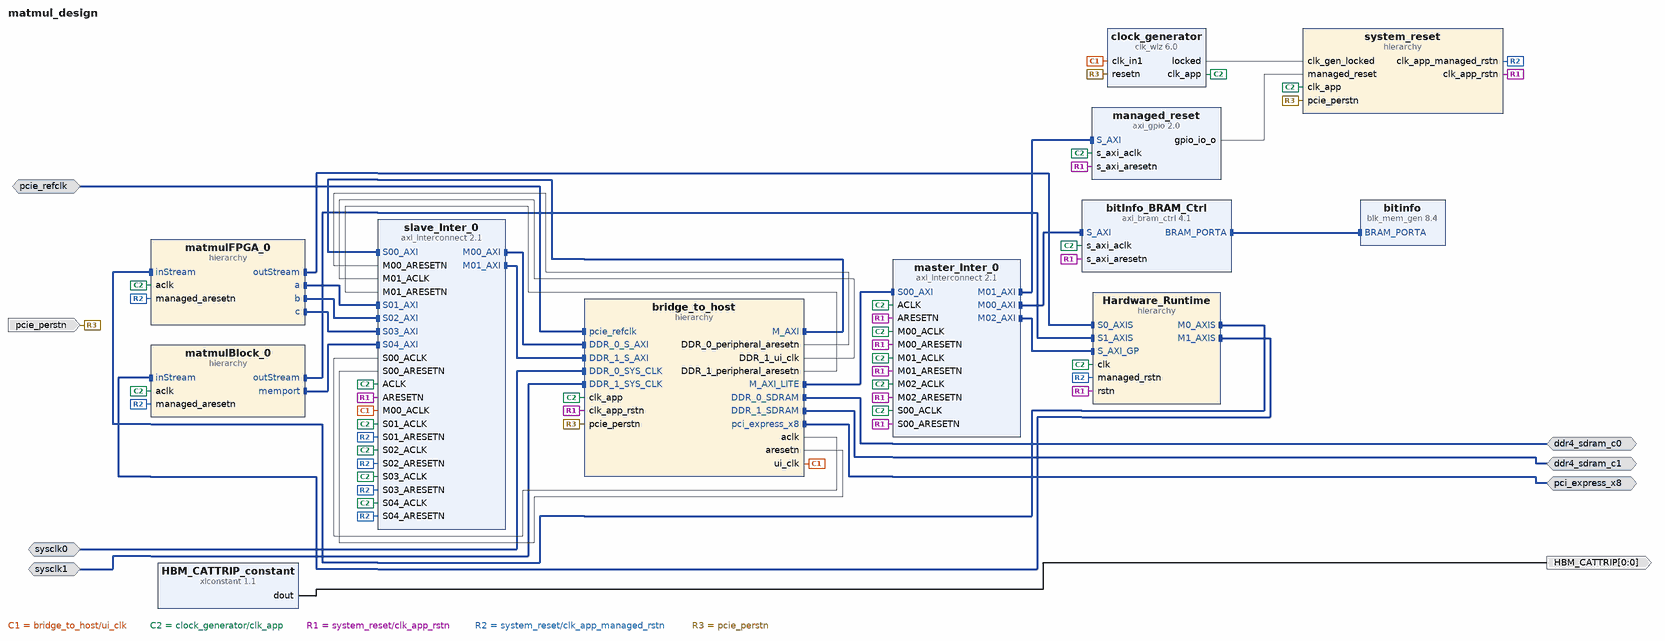
[diagram p0: block diagram of the top level]
# Vivado block design matmul_design, xcu280-fsvh2892-2L-e, Vivado 2023.2
create_bd_design matmul_design

create_bd_intf_port -mode Master -vlnv xilinx.com:interface:ddr4_rtl:1.0 ddr4_sdram_c0
create_bd_intf_port -mode Master -vlnv xilinx.com:interface:ddr4_rtl:1.0 ddr4_sdram_c1
create_bd_intf_port -mode Slave -vlnv xilinx.com:interface:diff_clock_rtl:1.0 sysclk0
create_bd_intf_port -mode Slave -vlnv xilinx.com:interface:diff_clock_rtl:1.0 sysclk1
create_bd_intf_port -mode Master -vlnv xilinx.com:interface:pcie_7x_mgt_rtl:1.0 pci_express_x8
create_bd_intf_port -mode Slave -vlnv xilinx.com:interface:diff_clock_rtl:1.0 pcie_refclk
set_property -dict {CONFIG.FREQ_HZ 100000000} [get_bd_intf_ports pcie_refclk]
create_bd_port -dir O -from 0 -to 0 HBM_CATTRIP
create_bd_port -dir I -type rst pcie_perstn
set_property -dict {CONFIG.POLARITY ACTIVE_LOW} [get_bd_ports pcie_perstn]

create_bd_cell -type hier bridge_to_host
create_bd_cell -type hier system_reset
create_bd_cell -type ip -vlnv xilinx.com:ip:clk_wiz:6.0 clock_generator
set_property -dict [list \
  CONFIG.CLKIN1_JITTER_PS 33.330000000000005 \
  CONFIG.CLKOUT1_JITTER 88.577 \
  CONFIG.CLKOUT1_PHASE_ERROR 77.836 \
  CONFIG.CLKOUT1_REQUESTED_OUT_FREQ 200 \
  CONFIG.CLK_OUT1_PORT clk_app \
  CONFIG.MMCM_CLKFBOUT_MULT_F 4.000 \
  CONFIG.MMCM_CLKIN1_PERIOD 3.333 \
  CONFIG.MMCM_CLKIN2_PERIOD 10.0 \
  CONFIG.MMCM_CLKOUT0_DIVIDE_F 6.000 \
  CONFIG.RESET_BOARD_INTERFACE resetn \
  CONFIG.RESET_PORT resetn \
  CONFIG.RESET_TYPE ACTIVE_LOW \
] [get_bd_cells clock_generator]
create_bd_cell -type ip -vlnv xilinx.com:ip:xlconstant:1.1 HBM_CATTRIP_constant
set_property -dict {CONFIG.CONST_VAL 0} [get_bd_cells HBM_CATTRIP_constant]
create_bd_cell -type ip -vlnv xilinx.com:ip:axi_interconnect:2.1 slave_Inter_0
set_property -dict {CONFIG.NUM_MI 2 CONFIG.NUM_SI 5 CONFIG.STRATEGY 2} [get_bd_cells slave_Inter_0]
create_bd_cell -type ip -vlnv xilinx.com:ip:blk_mem_gen:8.4 bitinfo
set_property -dict [list \
  CONFIG.Coe_File ../../../../../../../bitinfo.coe \
  CONFIG.Enable_32bit_Address true \
  CONFIG.Fill_Remaining_Memory_Locations false \
  CONFIG.Load_Init_File true \
  CONFIG.Memory_Type Single_Port_RAM \
  CONFIG.Read_Width_A 32 \
  CONFIG.Register_PortA_Output_of_Memory_Primitives false \
  CONFIG.Use_RSTA_Pin false \
  CONFIG.Write_Depth_A 82 \
  CONFIG.use_bram_block Stand_Alone \
] [get_bd_cells bitinfo]
create_bd_cell -type ip -vlnv xilinx.com:ip:axi_bram_ctrl:4.1 bitInfo_BRAM_Ctrl
set_property -dict {CONFIG.PROTOCOL AXI4LITE CONFIG.SINGLE_PORT_BRAM 1} [get_bd_cells bitInfo_BRAM_Ctrl]
create_bd_cell -type ip -vlnv xilinx.com:ip:axi_gpio:2.0 managed_reset
set_property -dict {CONFIG.C_ALL_OUTPUTS 1 CONFIG.C_DOUT_DEFAULT 0x00000001 CONFIG.C_GPIO_WIDTH 1} [get_bd_cells managed_reset]
create_bd_cell -type ip -vlnv xilinx.com:ip:axi_interconnect:2.1 master_Inter_0
set_property -dict {CONFIG.NUM_MI 3 CONFIG.NUM_SI 1 CONFIG.STRATEGY 2} [get_bd_cells master_Inter_0]
create_bd_cell -type hier Hardware_Runtime
create_bd_cell -type hier matmulFPGA_0
create_bd_cell -type hier matmulBlock_0

# ---- hierarchy /bridge_to_host ----
current_bd_instance /bridge_to_host
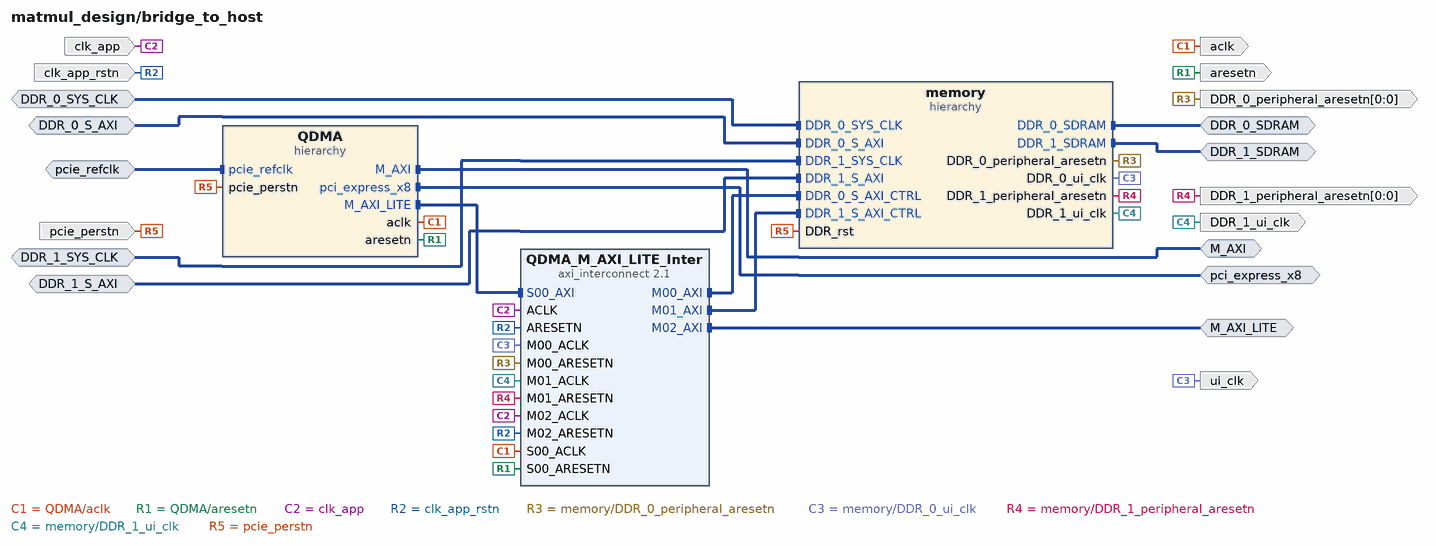
[diagram p1: block diagram inside /bridge_to_host]
create_bd_intf_pin -mode Master -vlnv xilinx.com:interface:aximm_rtl:1.0 M_AXI
create_bd_intf_pin -mode Master -vlnv xilinx.com:interface:aximm_rtl:1.0 M_AXI_LITE
create_bd_intf_pin -mode Master -vlnv xilinx.com:interface:ddr4_rtl:1.0 DDR_0_SDRAM
create_bd_intf_pin -mode Master -vlnv xilinx.com:interface:ddr4_rtl:1.0 DDR_1_SDRAM
create_bd_intf_pin -mode Master -vlnv xilinx.com:interface:pcie_7x_mgt_rtl:1.0 pci_express_x8
create_bd_intf_pin -mode Slave -vlnv xilinx.com:interface:aximm_rtl:1.0 DDR_0_S_AXI
create_bd_intf_pin -mode Slave -vlnv xilinx.com:interface:aximm_rtl:1.0 DDR_1_S_AXI
create_bd_intf_pin -mode Slave -vlnv xilinx.com:interface:diff_clock_rtl:1.0 DDR_0_SYS_CLK
create_bd_intf_pin -mode Slave -vlnv xilinx.com:interface:diff_clock_rtl:1.0 DDR_1_SYS_CLK
create_bd_intf_pin -mode Slave -vlnv xilinx.com:interface:diff_clock_rtl:1.0 pcie_refclk
create_bd_pin -dir O -type clk ui_clk
create_bd_pin -dir I -type clk clk_app
create_bd_pin -dir I -type rst clk_app_rstn
create_bd_pin -dir I -type rst pcie_perstn
create_bd_pin -dir O -from 0 -to 0 -type rst DDR_0_peripheral_aresetn
create_bd_pin -dir O -type clk DDR_1_ui_clk
create_bd_pin -dir O -from 0 -to 0 -type rst DDR_1_peripheral_aresetn
create_bd_pin -dir O -type clk aclk
create_bd_pin -dir O -type rst aresetn

create_bd_cell -type hier memory
create_bd_cell -type hier QDMA
create_bd_cell -type ip -vlnv xilinx.com:ip:axi_interconnect:2.1 QDMA_M_AXI_LITE_Inter
set_property -dict {CONFIG.NUM_MI 3} [get_bd_cells QDMA_M_AXI_LITE_Inter]

# ---- hierarchy /bridge_to_host/memory ----
current_bd_instance /bridge_to_host/memory
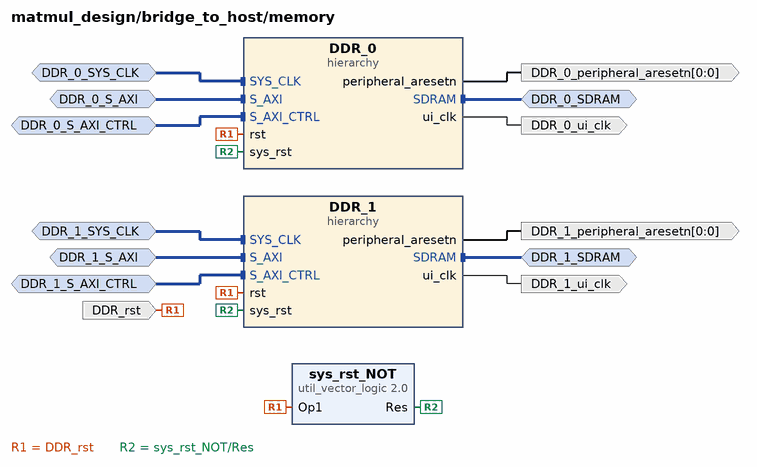
[diagram p2: block diagram inside /bridge_to_host/memory]
create_bd_intf_pin -mode Slave -vlnv xilinx.com:interface:aximm_rtl:1.0 DDR_0_S_AXI
create_bd_intf_pin -mode Slave -vlnv xilinx.com:interface:aximm_rtl:1.0 DDR_1_S_AXI
create_bd_intf_pin -mode Slave -vlnv xilinx.com:interface:aximm_rtl:1.0 DDR_0_S_AXI_CTRL
create_bd_intf_pin -mode Slave -vlnv xilinx.com:interface:aximm_rtl:1.0 DDR_1_S_AXI_CTRL
create_bd_intf_pin -mode Slave -vlnv xilinx.com:interface:diff_clock_rtl:1.0 DDR_0_SYS_CLK
create_bd_intf_pin -mode Slave -vlnv xilinx.com:interface:diff_clock_rtl:1.0 DDR_1_SYS_CLK
create_bd_intf_pin -mode Master -vlnv xilinx.com:interface:ddr4_rtl:1.0 DDR_0_SDRAM
create_bd_intf_pin -mode Master -vlnv xilinx.com:interface:ddr4_rtl:1.0 DDR_1_SDRAM
create_bd_pin -dir O -type clk DDR_0_ui_clk
create_bd_pin -dir O -type clk DDR_1_ui_clk
create_bd_pin -dir O -from 0 -to 0 -type rst DDR_0_peripheral_aresetn
create_bd_pin -dir O -from 0 -to 0 -type rst DDR_1_peripheral_aresetn
create_bd_pin -dir I -type rst DDR_rst

create_bd_cell -type hier DDR_0
create_bd_cell -type hier DDR_1
create_bd_cell -type ip -vlnv xilinx.com:ip:util_vector_logic:2.0 sys_rst_NOT
set_property -dict {CONFIG.C_OPERATION not CONFIG.C_SIZE 1} [get_bd_cells sys_rst_NOT]

# ---- hierarchy /bridge_to_host/memory/DDR_0 ----
current_bd_instance /bridge_to_host/memory/DDR_0
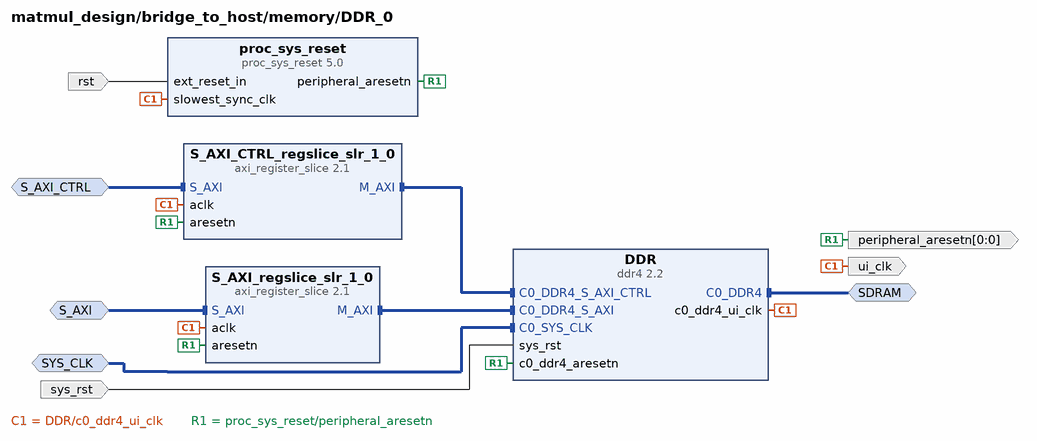
[diagram p3: block diagram inside /bridge_to_host/memory/DDR_0]
create_bd_intf_pin -mode Slave -vlnv xilinx.com:interface:diff_clock_rtl:1.0 SYS_CLK
create_bd_intf_pin -mode Slave -vlnv xilinx.com:interface:aximm_rtl:1.0 S_AXI
create_bd_intf_pin -mode Slave -vlnv xilinx.com:interface:aximm_rtl:1.0 S_AXI_CTRL
create_bd_intf_pin -mode Master -vlnv xilinx.com:interface:ddr4_rtl:1.0 SDRAM
create_bd_pin -dir O -from 0 -to 0 -type rst peripheral_aresetn
create_bd_pin -dir I -type rst rst
create_bd_pin -dir I -type rst sys_rst
create_bd_pin -dir O -type clk ui_clk

create_bd_cell -type ip -vlnv xilinx.com:ip:ddr4:2.2 DDR
set_property -dict [list \
  CONFIG.C0.DDR4_AUTO_AP_COL_A3 true \
  CONFIG.C0.DDR4_AxiAddressWidth 34 \
  CONFIG.C0.DDR4_Mem_Add_Map ROW_COLUMN_BANK_INTLV \
  CONFIG.C0_CLOCK_BOARD_INTERFACE sysclk0 \
  CONFIG.C0_DDR4_BOARD_INTERFACE ddr4_sdram_c0 \
  CONFIG.RESET_BOARD_INTERFACE pcie_perstn \
] [get_bd_cells DDR]
create_bd_cell -type ip -vlnv xilinx.com:ip:proc_sys_reset:5.0 proc_sys_reset
create_bd_cell -type ip -vlnv xilinx.com:ip:axi_register_slice:2.1 S_AXI_regslice_slr_1_0
set_property -dict [list \
  CONFIG.REG_AR 15 \
  CONFIG.REG_AW 15 \
  CONFIG.REG_B 15 \
  CONFIG.REG_R 15 \
  CONFIG.REG_W 15 \
  CONFIG.USE_AUTOPIPELINING 1 \
] [get_bd_cells S_AXI_regslice_slr_1_0]
create_bd_cell -type ip -vlnv xilinx.com:ip:axi_register_slice:2.1 S_AXI_CTRL_regslice_slr_1_0
set_property -dict [list \
  CONFIG.REG_AR 15 \
  CONFIG.REG_AW 15 \
  CONFIG.REG_B 15 \
  CONFIG.REG_R 15 \
  CONFIG.REG_W 15 \
  CONFIG.USE_AUTOPIPELINING 1 \
] [get_bd_cells S_AXI_CTRL_regslice_slr_1_0]

# ---- hierarchy /bridge_to_host/memory/DDR_1 ----
current_bd_instance /bridge_to_host/memory/DDR_1
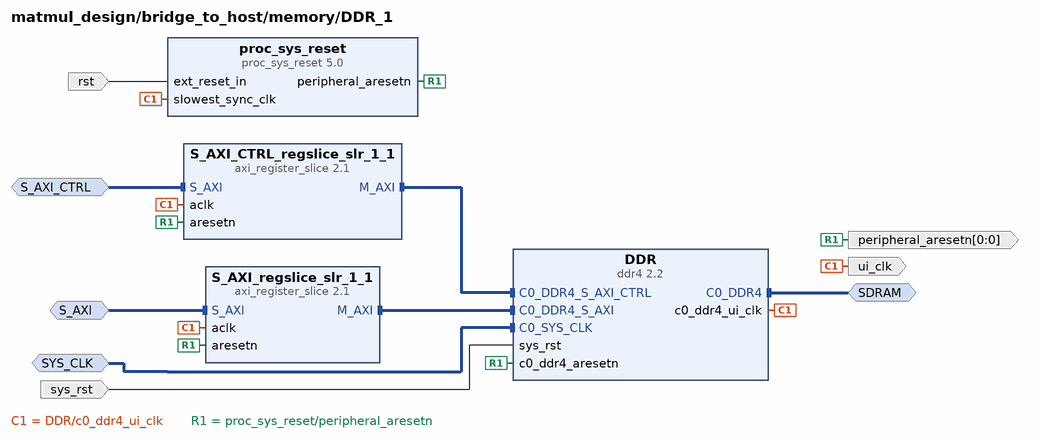
[diagram p4: block diagram inside /bridge_to_host/memory/DDR_1]
create_bd_intf_pin -mode Master -vlnv xilinx.com:interface:ddr4_rtl:1.0 SDRAM
create_bd_intf_pin -mode Slave -vlnv xilinx.com:interface:aximm_rtl:1.0 S_AXI
create_bd_intf_pin -mode Slave -vlnv xilinx.com:interface:aximm_rtl:1.0 S_AXI_CTRL
create_bd_intf_pin -mode Slave -vlnv xilinx.com:interface:diff_clock_rtl:1.0 SYS_CLK
create_bd_pin -dir O -from 0 -to 0 -type rst peripheral_aresetn
create_bd_pin -dir I -type rst rst
create_bd_pin -dir I -type rst sys_rst
create_bd_pin -dir O -type clk ui_clk

create_bd_cell -type ip -vlnv xilinx.com:ip:ddr4:2.2 DDR
set_property -dict [list \
  CONFIG.C0.DDR4_AUTO_AP_COL_A3 true \
  CONFIG.C0.DDR4_AxiAddressWidth 34 \
  CONFIG.C0.DDR4_Mem_Add_Map ROW_COLUMN_BANK_INTLV \
  CONFIG.C0_CLOCK_BOARD_INTERFACE sysclk1 \
  CONFIG.C0_DDR4_BOARD_INTERFACE ddr4_sdram_c1 \
  CONFIG.RESET_BOARD_INTERFACE pcie_perstn \
] [get_bd_cells DDR]
create_bd_cell -type ip -vlnv xilinx.com:ip:proc_sys_reset:5.0 proc_sys_reset
create_bd_cell -type ip -vlnv xilinx.com:ip:axi_register_slice:2.1 S_AXI_regslice_slr_1_1
set_property -dict [list \
  CONFIG.REG_AR 15 \
  CONFIG.REG_AW 15 \
  CONFIG.REG_B 15 \
  CONFIG.REG_R 15 \
  CONFIG.REG_W 15 \
  CONFIG.USE_AUTOPIPELINING 1 \
] [get_bd_cells S_AXI_regslice_slr_1_1]
create_bd_cell -type ip -vlnv xilinx.com:ip:axi_register_slice:2.1 S_AXI_CTRL_regslice_slr_1_1
set_property -dict [list \
  CONFIG.REG_AR 15 \
  CONFIG.REG_AW 15 \
  CONFIG.REG_B 15 \
  CONFIG.REG_R 15 \
  CONFIG.REG_W 15 \
  CONFIG.USE_AUTOPIPELINING 1 \
] [get_bd_cells S_AXI_CTRL_regslice_slr_1_1]

# ---- hierarchy /bridge_to_host/QDMA ----
current_bd_instance /bridge_to_host/QDMA
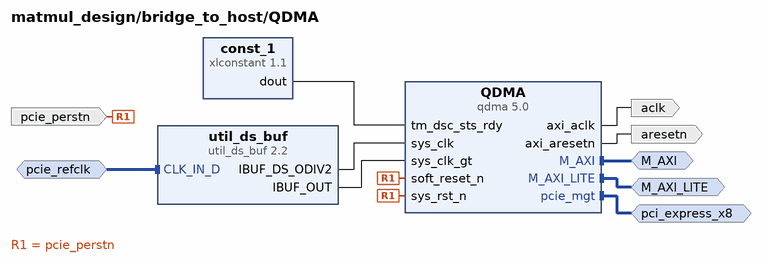
[diagram p5: block diagram inside /bridge_to_host/QDMA]
create_bd_intf_pin -mode Master -vlnv xilinx.com:interface:aximm_rtl:1.0 M_AXI
create_bd_intf_pin -mode Master -vlnv xilinx.com:interface:aximm_rtl:1.0 M_AXI_LITE
create_bd_intf_pin -mode Master -vlnv xilinx.com:interface:pcie_7x_mgt_rtl:1.0 pci_express_x8
create_bd_intf_pin -mode Slave -vlnv xilinx.com:interface:diff_clock_rtl:1.0 pcie_refclk
create_bd_pin -dir O -type clk aclk
create_bd_pin -dir O -type rst aresetn
create_bd_pin -dir I -type rst pcie_perstn

create_bd_cell -type ip -vlnv xilinx.com:ip:qdma:5.0 QDMA
set_property -dict [list \
  CONFIG.PF0_SRIOV_CAP_INITIAL_VF 4 \
  CONFIG.SRIOV_CAP_ENABLE true \
  CONFIG.barlite_mb_pf0 1 \
  CONFIG.barlite_mb_pf1 0 \
  CONFIG.barlite_mb_pf2 0 \
  CONFIG.barlite_mb_pf3 0 \
  CONFIG.copy_pf0 false \
  CONFIG.copy_sriov_pf0 false \
  CONFIG.dma_intf_sel_qdma AXI_MM \
  CONFIG.en_axi_st_qdma false \
  CONFIG.en_bridge false \
  CONFIG.en_gt_selection false \
  CONFIG.mode_selection Advanced \
  CONFIG.pf0_ari_enabled true \
  CONFIG.pf0_bar0_prefetchable_qdma true \
  CONFIG.pf0_bar2_prefetchable_qdma true \
  CONFIG.pf0_bar2_scale_qdma Megabytes \
  CONFIG.pf0_bar2_size_qdma 2 \
  CONFIG.pf1_bar0_prefetchable_qdma true \
  CONFIG.pf1_bar2_prefetchable_qdma true \
  CONFIG.pf2_bar0_prefetchable_qdma true \
  CONFIG.pf2_bar2_prefetchable_qdma true \
  CONFIG.pf3_bar0_prefetchable_qdma true \
  CONFIG.pf3_bar2_prefetchable_qdma true \
  CONFIG.testname mm \
  CONFIG.tl_pf_enable_reg 1 \
] [get_bd_cells QDMA]
create_bd_cell -type ip -vlnv xilinx.com:ip:xlconstant:1.1 const_1
create_bd_cell -type ip -vlnv xilinx.com:ip:util_ds_buf:2.2 util_ds_buf
set_property -dict {CONFIG.DIFF_CLK_IN_BOARD_INTERFACE pcie_refclk CONFIG.USE_BOARD_FLOW true} [get_bd_cells util_ds_buf]

# ---- hierarchy /system_reset ----
current_bd_instance /system_reset
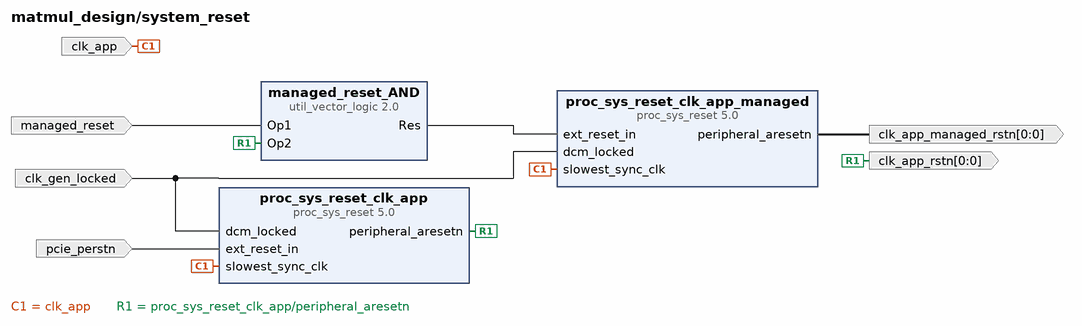
[diagram p6: block diagram inside /system_reset]
create_bd_pin -dir I -type rst pcie_perstn
create_bd_pin -dir I clk_gen_locked
create_bd_pin -dir I -type clk clk_app
create_bd_pin -dir O -from 0 -to 0 -type rst clk_app_rstn
create_bd_pin -dir I -type rst managed_reset
create_bd_pin -dir O -from 0 -to 0 -type rst clk_app_managed_rstn

create_bd_cell -type ip -vlnv xilinx.com:ip:proc_sys_reset:5.0 proc_sys_reset_clk_app
set_property -dict {CONFIG.C_EXT_RST_WIDTH 1} [get_bd_cells proc_sys_reset_clk_app]
create_bd_cell -type ip -vlnv xilinx.com:ip:util_vector_logic:2.0 managed_reset_AND
set_property -dict {CONFIG.C_OPERATION and CONFIG.C_SIZE 1} [get_bd_cells managed_reset_AND]
create_bd_cell -type ip -vlnv xilinx.com:ip:proc_sys_reset:5.0 proc_sys_reset_clk_app_managed
set_property -dict {CONFIG.C_EXT_RST_WIDTH 1} [get_bd_cells proc_sys_reset_clk_app_managed]

# ---- hierarchy /Hardware_Runtime ----
current_bd_instance /Hardware_Runtime
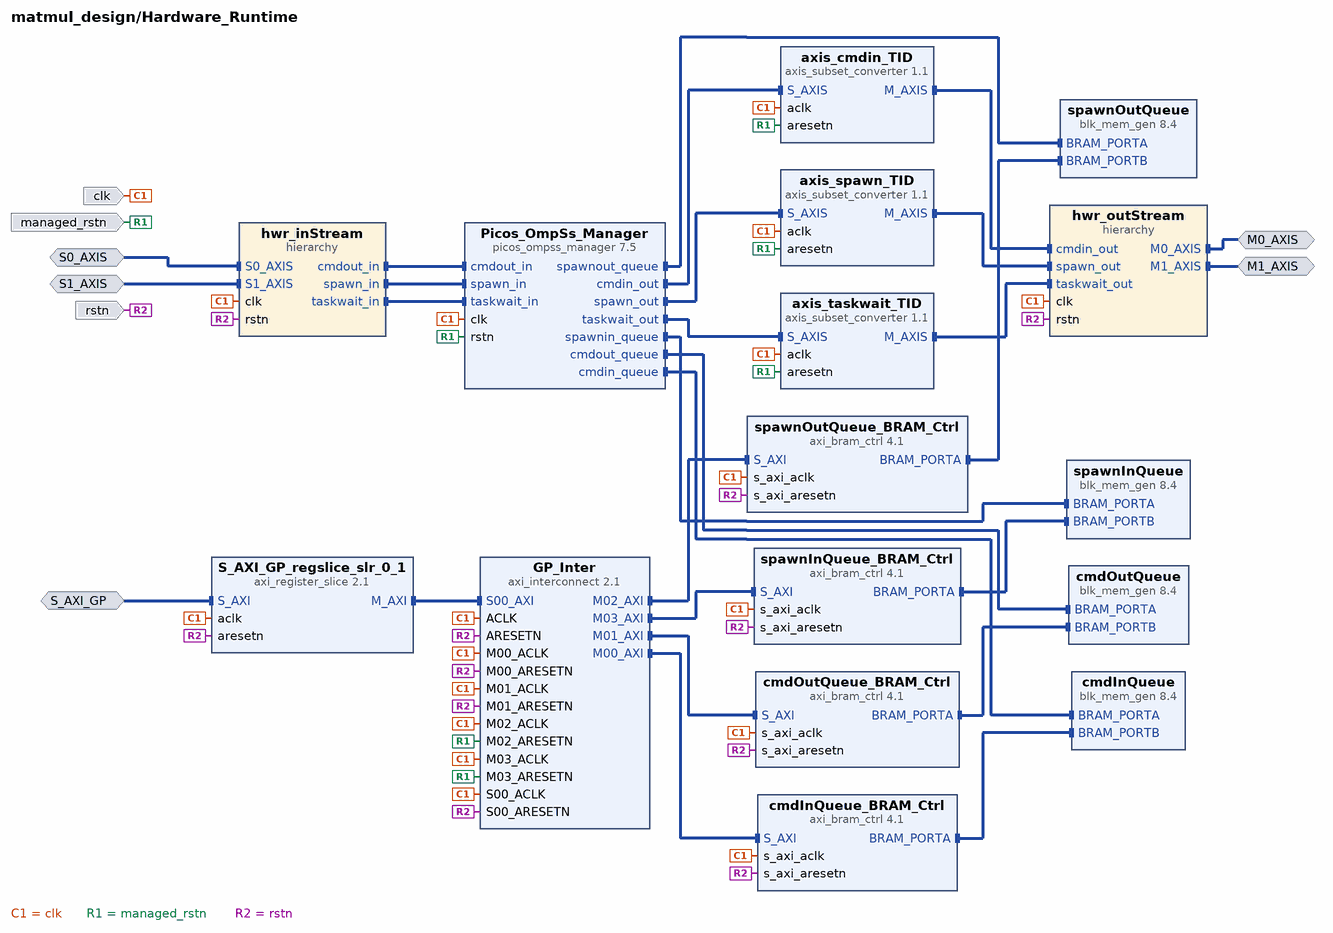
[diagram p7: block diagram inside /Hardware_Runtime]
create_bd_intf_pin -mode Slave -vlnv xilinx.com:interface:aximm_rtl:1.0 S_AXI_GP
create_bd_intf_pin -mode Slave -vlnv xilinx.com:interface:axis_rtl:1.0 S0_AXIS
create_bd_intf_pin -mode Master -vlnv xilinx.com:interface:axis_rtl:1.0 M0_AXIS
create_bd_intf_pin -mode Slave -vlnv xilinx.com:interface:axis_rtl:1.0 S1_AXIS
create_bd_intf_pin -mode Master -vlnv xilinx.com:interface:axis_rtl:1.0 M1_AXIS
create_bd_pin -dir I -type clk clk
create_bd_pin -dir I -type rst managed_rstn
create_bd_pin -dir I -type rst rstn

create_bd_cell -type hier hwr_inStream
create_bd_cell -type hier hwr_outStream
create_bd_cell -type ip -vlnv xilinx.com:ip:axi_interconnect:2.1 GP_Inter
set_property -dict {CONFIG.NUM_MI 4} [get_bd_cells GP_Inter]
create_bd_cell -type ip -vlnv xilinx.com:ip:axis_subset_converter:1.1 axis_cmdin_TID
set_property -dict {CONFIG.M_TID_WIDTH 1 CONFIG.TID_REMAP {1'b0}} [get_bd_cells axis_cmdin_TID]
create_bd_cell -type ip -vlnv xilinx.com:ip:axis_subset_converter:1.1 axis_spawn_TID
set_property -dict {CONFIG.M_TID_WIDTH 1 CONFIG.TID_REMAP {1'b1}} [get_bd_cells axis_spawn_TID]
create_bd_cell -type ip -vlnv xilinx.com:ip:axis_subset_converter:1.1 axis_taskwait_TID
set_property -dict {CONFIG.M_TID_WIDTH 1 CONFIG.TID_REMAP {1'b1}} [get_bd_cells axis_taskwait_TID]
create_bd_cell -type ip -vlnv bsc:ompss:picos_ompss_manager:7.5 Picos_OmpSs_Manager
set_property -dict [list \
  CONFIG.AXILITE_INTF false \
  CONFIG.CMDIN_SUBQUEUE_LEN 512 \
  CONFIG.CMDOUT_SUBQUEUE_LEN 512 \
  CONFIG.DM_DS BINTREE \
  CONFIG.DM_HASH P_PEARSON \
  CONFIG.DM_SIZE 512 \
  CONFIG.ENABLE_DEPS true \
  CONFIG.ENABLE_SPAWN_QUEUES true \
  CONFIG.ENABLE_TASK_CREATION true \
  CONFIG.HASH_T_SIZE 64 \
  CONFIG.LOCK_SUPPORT false \
  CONFIG.MAX_ACCS 2 \
  CONFIG.MAX_ACC_CREATORS 2 \
  CONFIG.MAX_ACC_TYPES 2 \
  CONFIG.MAX_ARGS_PER_TASK 15 \
  CONFIG.MAX_COPS_PER_TASK 15 \
  CONFIG.MAX_DEPS_PER_TASK 8 \
  CONFIG.NUM_DCTS 1 \
  CONFIG.SCHED_ACCID 0x00000000000000000000000000000100 \
  CONFIG.SCHED_COUNT 0x00000000000000000000000000000000 \
  CONFIG.SCHED_TTYPE 0x00000000000000000000000000000000000000000000000000000000000000000000000000000000000000000000000000000000000000009DF921925C16AF73 \
  CONFIG.SPAWNIN_QUEUE_LEN 1024 \
  CONFIG.SPAWNOUT_QUEUE_LEN 1024 \
  CONFIG.TM_SIZE 128 \
  CONFIG.VM_SIZE 512 \
] [get_bd_cells Picos_OmpSs_Manager]
create_bd_cell -type ip -vlnv xilinx.com:ip:blk_mem_gen:8.4 cmdInQueue
set_property -dict [list \
  CONFIG.Assume_Synchronous_Clk true \
  CONFIG.EN_SAFETY_CKT false \
  CONFIG.Enable_32bit_Address true \
  CONFIG.Enable_B Use_ENB_Pin \
  CONFIG.Memory_Type True_Dual_Port_RAM \
  CONFIG.Operating_Mode_A READ_FIRST \
  CONFIG.Operating_Mode_B READ_FIRST \
  CONFIG.Port_B_Clock 100 \
  CONFIG.Port_B_Enable_Rate 100 \
  CONFIG.Port_B_Write_Rate 50 \
  CONFIG.Read_Width_A 64 \
  CONFIG.Read_Width_B 32 \
  CONFIG.Register_PortA_Output_of_Memory_Primitives false \
  CONFIG.Register_PortB_Output_of_Memory_Primitives false \
  CONFIG.Use_RSTA_Pin false \
  CONFIG.Use_RSTB_Pin true \
  CONFIG.Write_Depth_A 1024 \
  CONFIG.Write_Width_A 64 \
  CONFIG.Write_Width_B 32 \
  CONFIG.use_bram_block Stand_Alone \
] [get_bd_cells cmdInQueue]
create_bd_cell -type ip -vlnv xilinx.com:ip:axi_bram_ctrl:4.1 cmdInQueue_BRAM_Ctrl
set_property -dict {CONFIG.PROTOCOL AXI4LITE CONFIG.SINGLE_PORT_BRAM 1} [get_bd_cells cmdInQueue_BRAM_Ctrl]
create_bd_cell -type ip -vlnv xilinx.com:ip:blk_mem_gen:8.4 cmdOutQueue
set_property -dict [list \
  CONFIG.Assume_Synchronous_Clk true \
  CONFIG.EN_SAFETY_CKT false \
  CONFIG.Enable_32bit_Address true \
  CONFIG.Enable_B Use_ENB_Pin \
  CONFIG.Memory_Type True_Dual_Port_RAM \
  CONFIG.Operating_Mode_A READ_FIRST \
  CONFIG.Operating_Mode_B READ_FIRST \
  CONFIG.Port_B_Clock 100 \
  CONFIG.Port_B_Enable_Rate 100 \
  CONFIG.Port_B_Write_Rate 50 \
  CONFIG.Read_Width_A 64 \
  CONFIG.Read_Width_B 32 \
  CONFIG.Register_PortA_Output_of_Memory_Primitives false \
  CONFIG.Register_PortB_Output_of_Memory_Primitives false \
  CONFIG.Use_RSTA_Pin false \
  CONFIG.Use_RSTB_Pin true \
  CONFIG.Write_Depth_A 1024 \
  CONFIG.Write_Width_A 64 \
  CONFIG.Write_Width_B 32 \
  CONFIG.use_bram_block Stand_Alone \
] [get_bd_cells cmdOutQueue]
create_bd_cell -type ip -vlnv xilinx.com:ip:axi_bram_ctrl:4.1 cmdOutQueue_BRAM_Ctrl
set_property -dict {CONFIG.PROTOCOL AXI4LITE CONFIG.SINGLE_PORT_BRAM 1} [get_bd_cells cmdOutQueue_BRAM_Ctrl]
create_bd_cell -type ip -vlnv xilinx.com:ip:blk_mem_gen:8.4 spawnInQueue
set_property -dict [list \
  CONFIG.Assume_Synchronous_Clk true \
  CONFIG.EN_SAFETY_CKT false \
  CONFIG.Enable_32bit_Address true \
  CONFIG.Enable_B Use_ENB_Pin \
  CONFIG.Memory_Type True_Dual_Port_RAM \
  CONFIG.Operating_Mode_A READ_FIRST \
  CONFIG.Operating_Mode_B READ_FIRST \
  CONFIG.Port_B_Clock 100 \
  CONFIG.Port_B_Enable_Rate 100 \
  CONFIG.Port_B_Write_Rate 50 \
  CONFIG.Read_Width_A 64 \
  CONFIG.Read_Width_B 32 \
  CONFIG.Register_PortA_Output_of_Memory_Primitives false \
  CONFIG.Register_PortB_Output_of_Memory_Primitives false \
  CONFIG.Use_RSTA_Pin false \
  CONFIG.Use_RSTB_Pin true \
  CONFIG.Write_Depth_A 1024 \
  CONFIG.Write_Width_A 64 \
  CONFIG.Write_Width_B 32 \
  CONFIG.use_bram_block Stand_Alone \
] [get_bd_cells spawnInQueue]
create_bd_cell -type ip -vlnv xilinx.com:ip:axi_bram_ctrl:4.1 spawnInQueue_BRAM_Ctrl
set_property -dict {CONFIG.PROTOCOL AXI4LITE CONFIG.SINGLE_PORT_BRAM 1} [get_bd_cells spawnInQueue_BRAM_Ctrl]
create_bd_cell -type ip -vlnv xilinx.com:ip:blk_mem_gen:8.4 spawnOutQueue
set_property -dict [list \
  CONFIG.Assume_Synchronous_Clk true \
  CONFIG.EN_SAFETY_CKT false \
  CONFIG.Enable_32bit_Address true \
  CONFIG.Enable_B Use_ENB_Pin \
  CONFIG.Memory_Type True_Dual_Port_RAM \
  CONFIG.Operating_Mode_A READ_FIRST \
  CONFIG.Operating_Mode_B READ_FIRST \
  CONFIG.Port_B_Clock 100 \
  CONFIG.Port_B_Enable_Rate 100 \
  CONFIG.Port_B_Write_Rate 50 \
  CONFIG.Read_Width_A 64 \
  CONFIG.Read_Width_B 32 \
  CONFIG.Register_PortA_Output_of_Memory_Primitives false \
  CONFIG.Register_PortB_Output_of_Memory_Primitives false \
  CONFIG.Use_RSTA_Pin false \
  CONFIG.Use_RSTB_Pin true \
  CONFIG.Write_Depth_A 1024 \
  CONFIG.Write_Width_A 64 \
  CONFIG.Write_Width_B 32 \
  CONFIG.use_bram_block Stand_Alone \
] [get_bd_cells spawnOutQueue]
create_bd_cell -type ip -vlnv xilinx.com:ip:axi_bram_ctrl:4.1 spawnOutQueue_BRAM_Ctrl
set_property -dict {CONFIG.PROTOCOL AXI4LITE CONFIG.SINGLE_PORT_BRAM 1} [get_bd_cells spawnOutQueue_BRAM_Ctrl]
create_bd_cell -type ip -vlnv xilinx.com:ip:axi_register_slice:2.1 S_AXI_GP_regslice_slr_0_1
set_property -dict [list \
  CONFIG.REG_AR 15 \
  CONFIG.REG_AW 15 \
  CONFIG.REG_B 15 \
  CONFIG.REG_R 15 \
  CONFIG.REG_W 15 \
  CONFIG.USE_AUTOPIPELINING 1 \
] [get_bd_cells S_AXI_GP_regslice_slr_0_1]

# ---- hierarchy /Hardware_Runtime/hwr_inStream ----
current_bd_instance /Hardware_Runtime/hwr_inStream
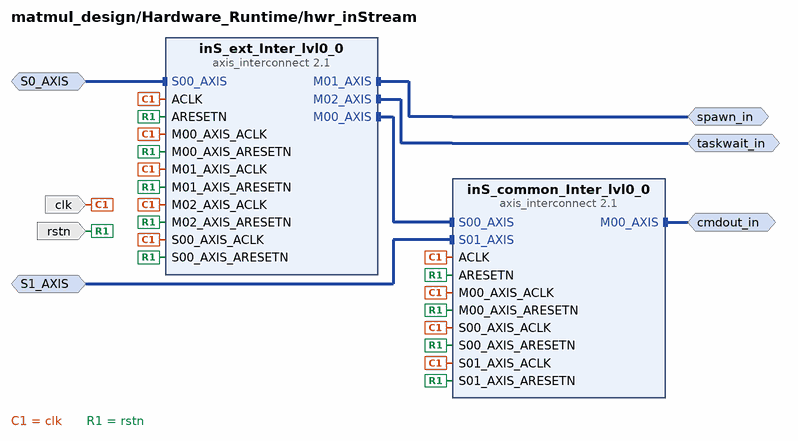
[diagram p8: block diagram inside /Hardware_Runtime/hwr_inStream]
create_bd_intf_pin -mode Slave -vlnv xilinx.com:interface:axis_rtl:1.0 S0_AXIS
create_bd_intf_pin -mode Slave -vlnv xilinx.com:interface:axis_rtl:1.0 S1_AXIS
create_bd_intf_pin -mode Master -vlnv xilinx.com:interface:axis_rtl:1.0 cmdout_in
create_bd_intf_pin -mode Master -vlnv xilinx.com:interface:axis_rtl:1.0 spawn_in
create_bd_intf_pin -mode Master -vlnv xilinx.com:interface:axis_rtl:1.0 taskwait_in
create_bd_pin -dir I -type clk clk
create_bd_pin -dir I -type rst rstn

create_bd_cell -type ip -vlnv xilinx.com:ip:axis_interconnect:2.1 inS_common_Inter_lvl0_0
set_property -dict [list \
  CONFIG.ARB_ON_MAX_XFERS 0 \
  CONFIG.ARB_ON_TLAST 1 \
  CONFIG.M00_AXIS_BASETDEST 0x00000000 \
  CONFIG.M00_AXIS_HIGHTDEST 0xFFFFFFFF \
  CONFIG.NUM_MI 1 \
  CONFIG.NUM_SI 2 \
] [get_bd_cells inS_common_Inter_lvl0_0]
create_bd_cell -type ip -vlnv xilinx.com:ip:axis_interconnect:2.1 inS_ext_Inter_lvl0_0
set_property -dict [list \
  CONFIG.M00_AXIS_BASETDEST 0x00000000 \
  CONFIG.M00_AXIS_HIGHTDEST 0x00000001 \
  CONFIG.M01_AXIS_BASETDEST 0x00000002 \
  CONFIG.M01_AXIS_HIGHTDEST 0x00000002 \
  CONFIG.M02_AXIS_BASETDEST 0x00000003 \
  CONFIG.M02_AXIS_HIGHTDEST 0x00000003 \
  CONFIG.NUM_MI 3 \
  CONFIG.NUM_SI 1 \
] [get_bd_cells inS_ext_Inter_lvl0_0]

# ---- hierarchy /Hardware_Runtime/hwr_outStream ----
current_bd_instance /Hardware_Runtime/hwr_outStream
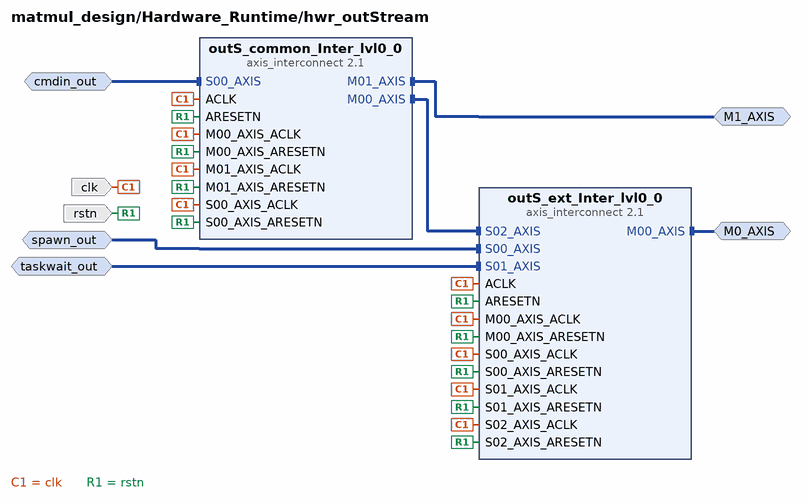
[diagram p9: block diagram inside /Hardware_Runtime/hwr_outStream]
create_bd_intf_pin -mode Master -vlnv xilinx.com:interface:axis_rtl:1.0 M0_AXIS
create_bd_intf_pin -mode Master -vlnv xilinx.com:interface:axis_rtl:1.0 M1_AXIS
create_bd_intf_pin -mode Slave -vlnv xilinx.com:interface:axis_rtl:1.0 cmdin_out
create_bd_intf_pin -mode Slave -vlnv xilinx.com:interface:axis_rtl:1.0 spawn_out
create_bd_intf_pin -mode Slave -vlnv xilinx.com:interface:axis_rtl:1.0 taskwait_out
create_bd_pin -dir I -type clk clk
create_bd_pin -dir I -type rst rstn

create_bd_cell -type ip -vlnv xilinx.com:ip:axis_interconnect:2.1 outS_ext_Inter_lvl0_0
set_property -dict [list \
  CONFIG.ARB_ON_MAX_XFERS 0 \
  CONFIG.ARB_ON_TLAST 1 \
  CONFIG.M00_AXIS_BASETDEST 0x00000000 \
  CONFIG.M00_AXIS_HIGHTDEST 0x00000000 \
  CONFIG.NUM_MI 1 \
  CONFIG.NUM_SI 3 \
] [get_bd_cells outS_ext_Inter_lvl0_0]
create_bd_cell -type ip -vlnv xilinx.com:ip:axis_interconnect:2.1 outS_common_Inter_lvl0_0
set_property -dict [list \
  CONFIG.M00_AXIS_BASETDEST 0x00000000 \
  CONFIG.M00_AXIS_HIGHTDEST 0x00000000 \
  CONFIG.M01_AXIS_BASETDEST 0x00000001 \
  CONFIG.M01_AXIS_HIGHTDEST 0x00000001 \
  CONFIG.NUM_MI 2 \
  CONFIG.NUM_SI 1 \
] [get_bd_cells outS_common_Inter_lvl0_0]

# ---- hierarchy /matmulFPGA_0 ----
current_bd_instance /matmulFPGA_0
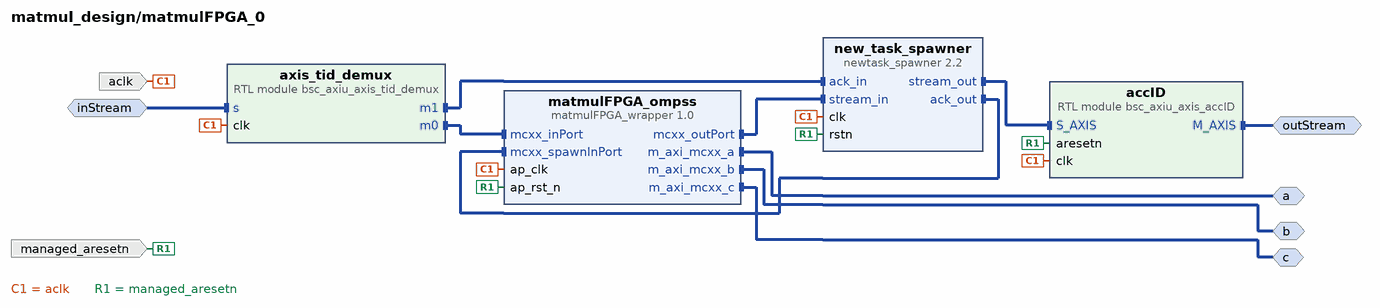
[diagram p10: block diagram inside /matmulFPGA_0]
create_bd_intf_pin -mode Slave -vlnv xilinx.com:interface:axis_rtl:1.0 inStream
create_bd_intf_pin -mode Master -vlnv xilinx.com:interface:axis_rtl:1.0 outStream
create_bd_intf_pin -mode Master -vlnv xilinx.com:interface:aximm_rtl:1.0 a
create_bd_intf_pin -mode Master -vlnv xilinx.com:interface:aximm_rtl:1.0 b
create_bd_intf_pin -mode Master -vlnv xilinx.com:interface:aximm_rtl:1.0 c
create_bd_pin -dir I -type clk aclk
create_bd_pin -dir I -type rst managed_aresetn

create_bd_cell -type ip -vlnv bsc:ompss:matmulFPGA_wrapper:1.0 matmulFPGA_ompss
create_bd_cell -type ip -vlnv bsc:ompss:newtask_spawner:2.2 new_task_spawner
set_property -dict [list \
  CONFIG.IMP False \
  CONFIG.MAX_ARGS_PER_TASK 15 \
  CONFIG.MAX_COPS_PER_TASK 15 \
  CONFIG.MAX_DEPS_PER_TASK 8 \
  CONFIG.MAX_OWNS_PER_TASK 8 \
] [get_bd_cells new_task_spawner]
create_bd_cell -type module -reference bsc_axiu_axis_tid_demux axis_tid_demux
create_bd_cell -type module -reference bsc_axiu_axis_accID accID
set_property -dict {CONFIG.ID 0 CONFIG.ID_WIDTH 1} [get_bd_cells accID]

# ---- hierarchy /matmulBlock_0 ----
current_bd_instance /matmulBlock_0
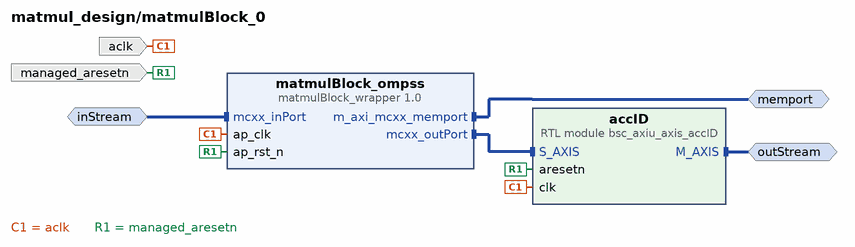
[diagram p11: block diagram inside /matmulBlock_0]
create_bd_intf_pin -mode Slave -vlnv xilinx.com:interface:axis_rtl:1.0 inStream
create_bd_intf_pin -mode Master -vlnv xilinx.com:interface:axis_rtl:1.0 outStream
create_bd_intf_pin -mode Master -vlnv xilinx.com:interface:aximm_rtl:1.0 memport
create_bd_pin -dir I -type clk aclk
create_bd_pin -dir I -type rst managed_aresetn

create_bd_cell -type ip -vlnv bsc:ompss:matmulBlock_wrapper:1.0 matmulBlock_ompss
create_bd_cell -type module -reference bsc_axiu_axis_accID accID
set_property -dict {CONFIG.ID 1 CONFIG.ID_WIDTH 1} [get_bd_cells accID]

# ---- connections ----

current_bd_instance /bridge_to_host
connect_bd_intf_net [get_bd_intf_pins DDR_0_SYS_CLK] [get_bd_intf_pins memory/DDR_0_SYS_CLK]
connect_bd_intf_net [get_bd_intf_pins DDR_0_S_AXI] [get_bd_intf_pins memory/DDR_0_S_AXI]
connect_bd_intf_net [get_bd_intf_pins DDR_1_SYS_CLK] [get_bd_intf_pins memory/DDR_1_SYS_CLK]
connect_bd_intf_net [get_bd_intf_pins DDR_1_S_AXI] [get_bd_intf_pins memory/DDR_1_S_AXI]
connect_bd_intf_net [get_bd_intf_pins QDMA/M_AXI] [get_bd_intf_pins M_AXI]
connect_bd_intf_net [get_bd_intf_pins QDMA/M_AXI_LITE] [get_bd_intf_pins QDMA_M_AXI_LITE_Inter/S00_AXI]
connect_bd_intf_net [get_bd_intf_pins memory/DDR_0_S_AXI_CTRL] [get_bd_intf_pins QDMA_M_AXI_LITE_Inter/M00_AXI]
connect_bd_intf_net [get_bd_intf_pins memory/DDR_1_S_AXI_CTRL] [get_bd_intf_pins QDMA_M_AXI_LITE_Inter/M01_AXI]
connect_bd_intf_net [get_bd_intf_pins M_AXI_LITE] [get_bd_intf_pins QDMA_M_AXI_LITE_Inter/M02_AXI]
connect_bd_intf_net [get_bd_intf_pins pci_express_x8] [get_bd_intf_pins QDMA/pci_express_x8]
connect_bd_intf_net [get_bd_intf_pins DDR_0_SDRAM] [get_bd_intf_pins memory/DDR_0_SDRAM]
connect_bd_intf_net [get_bd_intf_pins DDR_1_SDRAM] [get_bd_intf_pins memory/DDR_1_SDRAM]
connect_bd_intf_net [get_bd_intf_pins pcie_refclk] [get_bd_intf_pins QDMA/pcie_refclk]
connect_bd_net [get_bd_pins QDMA/aclk] [get_bd_pins QDMA_M_AXI_LITE_Inter/S00_ACLK] [get_bd_pins aclk]
connect_bd_net [get_bd_pins QDMA/aresetn] [get_bd_pins QDMA_M_AXI_LITE_Inter/S00_ARESETN] [get_bd_pins aresetn]
connect_bd_net [get_bd_pins clk_app] [get_bd_pins QDMA_M_AXI_LITE_Inter/ACLK] [get_bd_pins QDMA_M_AXI_LITE_Inter/M02_ACLK]
connect_bd_net [get_bd_pins clk_app_rstn] [get_bd_pins QDMA_M_AXI_LITE_Inter/ARESETN] [get_bd_pins QDMA_M_AXI_LITE_Inter/M02_ARESETN]
connect_bd_net [get_bd_pins memory/DDR_0_peripheral_aresetn] [get_bd_pins QDMA_M_AXI_LITE_Inter/M00_ARESETN] [get_bd_pins DDR_0_peripheral_aresetn]
connect_bd_net [get_bd_pins memory/DDR_0_ui_clk] [get_bd_pins ui_clk] [get_bd_pins QDMA_M_AXI_LITE_Inter/M00_ACLK]
connect_bd_net [get_bd_pins memory/DDR_1_peripheral_aresetn] [get_bd_pins QDMA_M_AXI_LITE_Inter/M01_ARESETN] [get_bd_pins DDR_1_peripheral_aresetn]
connect_bd_net [get_bd_pins memory/DDR_1_ui_clk] [get_bd_pins QDMA_M_AXI_LITE_Inter/M01_ACLK] [get_bd_pins DDR_1_ui_clk]
connect_bd_net [get_bd_pins pcie_perstn] [get_bd_pins memory/DDR_rst] [get_bd_pins QDMA/pcie_perstn]

current_bd_instance /bridge_to_host/memory
connect_bd_intf_net [get_bd_intf_pins DDR_0_SDRAM] [get_bd_intf_pins DDR_0/SDRAM]
connect_bd_intf_net [get_bd_intf_pins DDR_0_SYS_CLK] [get_bd_intf_pins DDR_0/SYS_CLK]
connect_bd_intf_net [get_bd_intf_pins DDR_0_S_AXI] [get_bd_intf_pins DDR_0/S_AXI]
connect_bd_intf_net [get_bd_intf_pins DDR_0_S_AXI_CTRL] [get_bd_intf_pins DDR_0/S_AXI_CTRL]
connect_bd_intf_net [get_bd_intf_pins DDR_1_SDRAM] [get_bd_intf_pins DDR_1/SDRAM]
connect_bd_intf_net [get_bd_intf_pins DDR_1_SYS_CLK] [get_bd_intf_pins DDR_1/SYS_CLK]
connect_bd_intf_net [get_bd_intf_pins DDR_1_S_AXI] [get_bd_intf_pins DDR_1/S_AXI]
connect_bd_intf_net [get_bd_intf_pins DDR_1_S_AXI_CTRL] [get_bd_intf_pins DDR_1/S_AXI_CTRL]
connect_bd_net [get_bd_pins DDR_0/peripheral_aresetn] [get_bd_pins DDR_0_peripheral_aresetn]
connect_bd_net [get_bd_pins DDR_0/ui_clk] [get_bd_pins DDR_0_ui_clk]
connect_bd_net [get_bd_pins DDR_1/peripheral_aresetn] [get_bd_pins DDR_1_peripheral_aresetn]
connect_bd_net [get_bd_pins DDR_1/ui_clk] [get_bd_pins DDR_1_ui_clk]
connect_bd_net [get_bd_pins DDR_rst] [get_bd_pins DDR_0/rst] [get_bd_pins DDR_1/rst] [get_bd_pins sys_rst_NOT/Op1]
connect_bd_net [get_bd_pins sys_rst_NOT/Res] [get_bd_pins DDR_0/sys_rst] [get_bd_pins DDR_1/sys_rst]

current_bd_instance /bridge_to_host/memory/DDR_0
connect_bd_intf_net [get_bd_intf_pins SDRAM] [get_bd_intf_pins DDR/C0_DDR4]
connect_bd_intf_net [get_bd_intf_pins SYS_CLK] [get_bd_intf_pins DDR/C0_SYS_CLK]
connect_bd_intf_net [get_bd_intf_pins S_AXI] [get_bd_intf_pins S_AXI_regslice_slr_1_0/S_AXI]
connect_bd_intf_net [get_bd_intf_pins S_AXI_CTRL] [get_bd_intf_pins S_AXI_CTRL_regslice_slr_1_0/S_AXI]
connect_bd_intf_net [get_bd_intf_pins S_AXI_CTRL_regslice_slr_1_0/M_AXI] [get_bd_intf_pins DDR/C0_DDR4_S_AXI_CTRL]
connect_bd_intf_net [get_bd_intf_pins S_AXI_regslice_slr_1_0/M_AXI] [get_bd_intf_pins DDR/C0_DDR4_S_AXI]
connect_bd_net -net c0_ddr4_ui_clk_1 [get_bd_pins DDR/c0_ddr4_ui_clk] \
  [get_bd_pins ui_clk] [get_bd_pins proc_sys_reset/slowest_sync_clk] [get_bd_pins S_AXI_regslice_slr_1_0/aclk] \
  [get_bd_pins S_AXI_CTRL_regslice_slr_1_0/aclk]
connect_bd_net [get_bd_pins proc_sys_reset/peripheral_aresetn] \
  [get_bd_pins peripheral_aresetn] [get_bd_pins DDR/c0_ddr4_aresetn] [get_bd_pins S_AXI_regslice_slr_1_0/aresetn] \
  [get_bd_pins S_AXI_CTRL_regslice_slr_1_0/aresetn]
connect_bd_net [get_bd_pins rst] [get_bd_pins proc_sys_reset/ext_reset_in]
connect_bd_net [get_bd_pins sys_rst] [get_bd_pins DDR/sys_rst]

current_bd_instance /bridge_to_host/memory/DDR_1
connect_bd_intf_net [get_bd_intf_pins SDRAM] [get_bd_intf_pins DDR/C0_DDR4]
connect_bd_intf_net [get_bd_intf_pins SYS_CLK] [get_bd_intf_pins DDR/C0_SYS_CLK]
connect_bd_intf_net [get_bd_intf_pins S_AXI] [get_bd_intf_pins S_AXI_regslice_slr_1_1/S_AXI]
connect_bd_intf_net [get_bd_intf_pins S_AXI_CTRL] [get_bd_intf_pins S_AXI_CTRL_regslice_slr_1_1/S_AXI]
connect_bd_intf_net [get_bd_intf_pins S_AXI_CTRL_regslice_slr_1_1/M_AXI] [get_bd_intf_pins DDR/C0_DDR4_S_AXI_CTRL]
connect_bd_intf_net [get_bd_intf_pins S_AXI_regslice_slr_1_1/M_AXI] [get_bd_intf_pins DDR/C0_DDR4_S_AXI]
connect_bd_net -net c0_ddr4_ui_clk_1 [get_bd_pins DDR/c0_ddr4_ui_clk] \
  [get_bd_pins ui_clk] [get_bd_pins proc_sys_reset/slowest_sync_clk] [get_bd_pins S_AXI_regslice_slr_1_1/aclk] \
  [get_bd_pins S_AXI_CTRL_regslice_slr_1_1/aclk]
connect_bd_net [get_bd_pins proc_sys_reset/peripheral_aresetn] \
  [get_bd_pins peripheral_aresetn] [get_bd_pins DDR/c0_ddr4_aresetn] [get_bd_pins S_AXI_regslice_slr_1_1/aresetn] \
  [get_bd_pins S_AXI_CTRL_regslice_slr_1_1/aresetn]
connect_bd_net [get_bd_pins rst] [get_bd_pins proc_sys_reset/ext_reset_in]
connect_bd_net [get_bd_pins sys_rst] [get_bd_pins DDR/sys_rst]

current_bd_instance /bridge_to_host/QDMA
connect_bd_intf_net [get_bd_intf_pins M_AXI] [get_bd_intf_pins QDMA/M_AXI]
connect_bd_intf_net [get_bd_intf_pins M_AXI_LITE] [get_bd_intf_pins QDMA/M_AXI_LITE]
connect_bd_intf_net [get_bd_intf_pins pci_express_x8] [get_bd_intf_pins QDMA/pcie_mgt]
connect_bd_intf_net [get_bd_intf_pins pcie_refclk] [get_bd_intf_pins util_ds_buf/CLK_IN_D]
connect_bd_net [get_bd_pins QDMA/axi_aclk] [get_bd_pins aclk]
connect_bd_net [get_bd_pins QDMA/axi_aresetn] [get_bd_pins aresetn]
connect_bd_net [get_bd_pins const_1/dout] [get_bd_pins QDMA/tm_dsc_sts_rdy]
connect_bd_net [get_bd_pins pcie_perstn] [get_bd_pins QDMA/soft_reset_n] [get_bd_pins QDMA/sys_rst_n]
connect_bd_net [get_bd_pins util_ds_buf/IBUF_DS_ODIV2] [get_bd_pins QDMA/sys_clk]
connect_bd_net [get_bd_pins util_ds_buf/IBUF_OUT] [get_bd_pins QDMA/sys_clk_gt]

current_bd_instance /system_reset
connect_bd_net [get_bd_pins clk_app] \
  [get_bd_pins proc_sys_reset_clk_app/slowest_sync_clk] [get_bd_pins proc_sys_reset_clk_app_managed/slowest_sync_clk]
connect_bd_net [get_bd_pins clk_gen_locked] [get_bd_pins proc_sys_reset_clk_app/dcm_locked] [get_bd_pins proc_sys_reset_clk_app_managed/dcm_locked]
connect_bd_net [get_bd_pins managed_reset] [get_bd_pins managed_reset_AND/Op1]
connect_bd_net [get_bd_pins managed_reset_AND/Res] [get_bd_pins proc_sys_reset_clk_app_managed/ext_reset_in]
connect_bd_net [get_bd_pins pcie_perstn] [get_bd_pins proc_sys_reset_clk_app/ext_reset_in]
connect_bd_net [get_bd_pins proc_sys_reset_clk_app_managed/peripheral_aresetn] [get_bd_pins clk_app_managed_rstn]
connect_bd_net [get_bd_pins proc_sys_reset_clk_app/peripheral_aresetn] [get_bd_pins clk_app_rstn] [get_bd_pins managed_reset_AND/Op2]

current_bd_instance /Hardware_Runtime
connect_bd_intf_net [get_bd_intf_pins hwr_inStream/S0_AXIS] [get_bd_intf_pins S0_AXIS]
connect_bd_intf_net [get_bd_intf_pins hwr_outStream/M0_AXIS] [get_bd_intf_pins M0_AXIS]
connect_bd_intf_net [get_bd_intf_pins hwr_inStream/S1_AXIS] [get_bd_intf_pins S1_AXIS]
connect_bd_intf_net [get_bd_intf_pins hwr_outStream/M1_AXIS] [get_bd_intf_pins M1_AXIS]
connect_bd_intf_net [get_bd_intf_pins GP_Inter/M00_AXI] [get_bd_intf_pins cmdInQueue_BRAM_Ctrl/S_AXI]
connect_bd_intf_net [get_bd_intf_pins GP_Inter/M01_AXI] [get_bd_intf_pins cmdOutQueue_BRAM_Ctrl/S_AXI]
connect_bd_intf_net [get_bd_intf_pins GP_Inter/M03_AXI] [get_bd_intf_pins spawnInQueue_BRAM_Ctrl/S_AXI]
connect_bd_intf_net [get_bd_intf_pins GP_Inter/M02_AXI] [get_bd_intf_pins spawnOutQueue_BRAM_Ctrl/S_AXI]
connect_bd_intf_net [get_bd_intf_pins Picos_OmpSs_Manager/cmdin_queue] [get_bd_intf_pins cmdInQueue/BRAM_PORTA]
connect_bd_intf_net [get_bd_intf_pins Picos_OmpSs_Manager/cmdout_queue] [get_bd_intf_pins cmdOutQueue/BRAM_PORTA]
connect_bd_intf_net [get_bd_intf_pins Picos_OmpSs_Manager/cmdin_out] [get_bd_intf_pins axis_cmdin_TID/S_AXIS]
connect_bd_intf_net [get_bd_intf_pins Picos_OmpSs_Manager/spawnin_queue] [get_bd_intf_pins spawnInQueue/BRAM_PORTA]
connect_bd_intf_net [get_bd_intf_pins Picos_OmpSs_Manager/spawnout_queue] [get_bd_intf_pins spawnOutQueue/BRAM_PORTA]
connect_bd_intf_net [get_bd_intf_pins Picos_OmpSs_Manager/spawn_out] [get_bd_intf_pins axis_spawn_TID/S_AXIS]
connect_bd_intf_net [get_bd_intf_pins Picos_OmpSs_Manager/taskwait_out] [get_bd_intf_pins axis_taskwait_TID/S_AXIS]
connect_bd_intf_net [get_bd_intf_pins S_AXI_GP] [get_bd_intf_pins S_AXI_GP_regslice_slr_0_1/S_AXI]
connect_bd_intf_net [get_bd_intf_pins S_AXI_GP_regslice_slr_0_1/M_AXI] [get_bd_intf_pins GP_Inter/S00_AXI]
connect_bd_intf_net [get_bd_intf_pins cmdInQueue/BRAM_PORTB] [get_bd_intf_pins cmdInQueue_BRAM_Ctrl/BRAM_PORTA]
connect_bd_intf_net [get_bd_intf_pins cmdOutQueue/BRAM_PORTB] [get_bd_intf_pins cmdOutQueue_BRAM_Ctrl/BRAM_PORTA]
connect_bd_intf_net [get_bd_intf_pins hwr_outStream/cmdin_out] [get_bd_intf_pins axis_cmdin_TID/M_AXIS]
connect_bd_intf_net [get_bd_intf_pins Picos_OmpSs_Manager/cmdout_in] [get_bd_intf_pins hwr_inStream/cmdout_in]
connect_bd_intf_net [get_bd_intf_pins Picos_OmpSs_Manager/spawn_in] [get_bd_intf_pins hwr_inStream/spawn_in]
connect_bd_intf_net [get_bd_intf_pins Picos_OmpSs_Manager/taskwait_in] [get_bd_intf_pins hwr_inStream/taskwait_in]
connect_bd_intf_net [get_bd_intf_pins spawnInQueue/BRAM_PORTB] [get_bd_intf_pins spawnInQueue_BRAM_Ctrl/BRAM_PORTA]
connect_bd_intf_net [get_bd_intf_pins spawnOutQueue/BRAM_PORTB] [get_bd_intf_pins spawnOutQueue_BRAM_Ctrl/BRAM_PORTA]
connect_bd_intf_net [get_bd_intf_pins hwr_outStream/spawn_out] [get_bd_intf_pins axis_spawn_TID/M_AXIS]
connect_bd_intf_net [get_bd_intf_pins hwr_outStream/taskwait_out] [get_bd_intf_pins axis_taskwait_TID/M_AXIS]
connect_bd_net [get_bd_pins clk] \
  [get_bd_pins spawnInQueue_BRAM_Ctrl/s_axi_aclk] [get_bd_pins spawnOutQueue_BRAM_Ctrl/s_axi_aclk] \
  [get_bd_pins GP_Inter/ACLK] [get_bd_pins GP_Inter/M00_ACLK] [get_bd_pins GP_Inter/M01_ACLK] [get_bd_pins GP_Inter/S00_ACLK] \
  [get_bd_pins Picos_OmpSs_Manager/clk] [get_bd_pins cmdInQueue_BRAM_Ctrl/s_axi_aclk] \
  [get_bd_pins cmdOutQueue_BRAM_Ctrl/s_axi_aclk] [get_bd_pins hwr_inStream/clk] [get_bd_pins hwr_outStream/clk] \
  [get_bd_pins axis_cmdin_TID/aclk] [get_bd_pins axis_spawn_TID/aclk] [get_bd_pins axis_taskwait_TID/aclk] \
  [get_bd_pins GP_Inter/M02_ACLK] [get_bd_pins GP_Inter/M03_ACLK] [get_bd_pins S_AXI_GP_regslice_slr_0_1/aclk]
connect_bd_net [get_bd_pins managed_rstn] \
  [get_bd_pins Picos_OmpSs_Manager/rstn] [get_bd_pins axis_cmdin_TID/aresetn] [get_bd_pins axis_spawn_TID/aresetn] \
  [get_bd_pins axis_taskwait_TID/aresetn] [get_bd_pins GP_Inter/M02_ARESETN] [get_bd_pins GP_Inter/M03_ARESETN]
connect_bd_net [get_bd_pins rstn] \
  [get_bd_pins spawnInQueue_BRAM_Ctrl/s_axi_aresetn] [get_bd_pins spawnOutQueue_BRAM_Ctrl/s_axi_aresetn] \
  [get_bd_pins GP_Inter/ARESETN] [get_bd_pins hwr_inStream/rstn] [get_bd_pins hwr_outStream/rstn] \
  [get_bd_pins GP_Inter/M00_ARESETN] [get_bd_pins GP_Inter/M01_ARESETN] [get_bd_pins GP_Inter/S00_ARESETN] \
  [get_bd_pins cmdInQueue_BRAM_Ctrl/s_axi_aresetn] [get_bd_pins cmdOutQueue_BRAM_Ctrl/s_axi_aresetn] \
  [get_bd_pins S_AXI_GP_regslice_slr_0_1/aresetn]

current_bd_instance /Hardware_Runtime/hwr_inStream
connect_bd_intf_net [get_bd_intf_pins S0_AXIS] [get_bd_intf_pins inS_ext_Inter_lvl0_0/S00_AXIS]
connect_bd_intf_net [get_bd_intf_pins S1_AXIS] [get_bd_intf_pins inS_common_Inter_lvl0_0/S01_AXIS]
connect_bd_intf_net [get_bd_intf_pins inS_common_Inter_lvl0_0/M00_AXIS] [get_bd_intf_pins cmdout_in]
connect_bd_intf_net [get_bd_intf_pins inS_ext_Inter_lvl0_0/M00_AXIS] [get_bd_intf_pins inS_common_Inter_lvl0_0/S00_AXIS]
connect_bd_intf_net [get_bd_intf_pins inS_ext_Inter_lvl0_0/M01_AXIS] [get_bd_intf_pins spawn_in]
connect_bd_intf_net [get_bd_intf_pins inS_ext_Inter_lvl0_0/M02_AXIS] [get_bd_intf_pins taskwait_in]
connect_bd_net [get_bd_pins clk] \
  [get_bd_pins inS_common_Inter_lvl0_0/ACLK] [get_bd_pins inS_common_Inter_lvl0_0/S00_AXIS_ACLK] \
  [get_bd_pins inS_common_Inter_lvl0_0/S01_AXIS_ACLK] [get_bd_pins inS_common_Inter_lvl0_0/M00_AXIS_ACLK] \
  [get_bd_pins inS_ext_Inter_lvl0_0/ACLK] [get_bd_pins inS_ext_Inter_lvl0_0/S00_AXIS_ACLK] \
  [get_bd_pins inS_ext_Inter_lvl0_0/M00_AXIS_ACLK] [get_bd_pins inS_ext_Inter_lvl0_0/M01_AXIS_ACLK] \
  [get_bd_pins inS_ext_Inter_lvl0_0/M02_AXIS_ACLK]
connect_bd_net [get_bd_pins rstn] \
  [get_bd_pins inS_common_Inter_lvl0_0/ARESETN] [get_bd_pins inS_common_Inter_lvl0_0/S00_AXIS_ARESETN] \
  [get_bd_pins inS_common_Inter_lvl0_0/S01_AXIS_ARESETN] [get_bd_pins inS_common_Inter_lvl0_0/M00_AXIS_ARESETN] \
  [get_bd_pins inS_ext_Inter_lvl0_0/ARESETN] [get_bd_pins inS_ext_Inter_lvl0_0/S00_AXIS_ARESETN] \
  [get_bd_pins inS_ext_Inter_lvl0_0/M00_AXIS_ARESETN] [get_bd_pins inS_ext_Inter_lvl0_0/M01_AXIS_ARESETN] \
  [get_bd_pins inS_ext_Inter_lvl0_0/M02_AXIS_ARESETN]

current_bd_instance /Hardware_Runtime/hwr_outStream
connect_bd_intf_net [get_bd_intf_pins cmdin_out] [get_bd_intf_pins outS_common_Inter_lvl0_0/S00_AXIS]
connect_bd_intf_net [get_bd_intf_pins outS_common_Inter_lvl0_0/M00_AXIS] [get_bd_intf_pins outS_ext_Inter_lvl0_0/S02_AXIS]
connect_bd_intf_net [get_bd_intf_pins outS_common_Inter_lvl0_0/M01_AXIS] [get_bd_intf_pins M1_AXIS]
connect_bd_intf_net [get_bd_intf_pins outS_ext_Inter_lvl0_0/M00_AXIS] [get_bd_intf_pins M0_AXIS]
connect_bd_intf_net [get_bd_intf_pins spawn_out] [get_bd_intf_pins outS_ext_Inter_lvl0_0/S00_AXIS]
connect_bd_intf_net [get_bd_intf_pins taskwait_out] [get_bd_intf_pins outS_ext_Inter_lvl0_0/S01_AXIS]
connect_bd_net [get_bd_pins clk] \
  [get_bd_pins outS_ext_Inter_lvl0_0/ACLK] [get_bd_pins outS_ext_Inter_lvl0_0/M00_AXIS_ACLK] \
  [get_bd_pins outS_ext_Inter_lvl0_0/S00_AXIS_ACLK] [get_bd_pins outS_ext_Inter_lvl0_0/S01_AXIS_ACLK] \
  [get_bd_pins outS_ext_Inter_lvl0_0/S02_AXIS_ACLK] [get_bd_pins outS_common_Inter_lvl0_0/ACLK] \
  [get_bd_pins outS_common_Inter_lvl0_0/M00_AXIS_ACLK] [get_bd_pins outS_common_Inter_lvl0_0/M01_AXIS_ACLK] \
  [get_bd_pins outS_common_Inter_lvl0_0/S00_AXIS_ACLK]
connect_bd_net [get_bd_pins rstn] \
  [get_bd_pins outS_ext_Inter_lvl0_0/ARESETN] [get_bd_pins outS_ext_Inter_lvl0_0/M00_AXIS_ARESETN] \
  [get_bd_pins outS_ext_Inter_lvl0_0/S00_AXIS_ARESETN] [get_bd_pins outS_ext_Inter_lvl0_0/S01_AXIS_ARESETN] \
  [get_bd_pins outS_ext_Inter_lvl0_0/S02_AXIS_ARESETN] [get_bd_pins outS_common_Inter_lvl0_0/ARESETN] \
  [get_bd_pins outS_common_Inter_lvl0_0/M00_AXIS_ARESETN] [get_bd_pins outS_common_Inter_lvl0_0/M01_AXIS_ARESETN] \
  [get_bd_pins outS_common_Inter_lvl0_0/S00_AXIS_ARESETN]

current_bd_instance /matmulFPGA_0
connect_bd_intf_net [get_bd_intf_pins accID/M_AXIS] [get_bd_intf_pins outStream]
connect_bd_intf_net [get_bd_intf_pins axis_tid_demux/m0] [get_bd_intf_pins matmulFPGA_ompss/mcxx_inPort]
connect_bd_intf_net [get_bd_intf_pins axis_tid_demux/m1] [get_bd_intf_pins new_task_spawner/ack_in]
connect_bd_intf_net [get_bd_intf_pins inStream] [get_bd_intf_pins axis_tid_demux/s]
connect_bd_intf_net [get_bd_intf_pins matmulFPGA_ompss/m_axi_mcxx_a] [get_bd_intf_pins a]
connect_bd_intf_net [get_bd_intf_pins matmulFPGA_ompss/m_axi_mcxx_b] [get_bd_intf_pins b]
connect_bd_intf_net [get_bd_intf_pins matmulFPGA_ompss/m_axi_mcxx_c] [get_bd_intf_pins c]
connect_bd_intf_net [get_bd_intf_pins matmulFPGA_ompss/mcxx_outPort] [get_bd_intf_pins new_task_spawner/stream_in]
connect_bd_intf_net [get_bd_intf_pins new_task_spawner/ack_out] [get_bd_intf_pins matmulFPGA_ompss/mcxx_spawnInPort]
connect_bd_intf_net [get_bd_intf_pins new_task_spawner/stream_out] [get_bd_intf_pins accID/S_AXIS]
connect_bd_net [get_bd_pins aclk] \
  [get_bd_pins matmulFPGA_ompss/ap_clk] [get_bd_pins new_task_spawner/clk] [get_bd_pins axis_tid_demux/clk] \
  [get_bd_pins accID/clk]
connect_bd_net [get_bd_pins managed_aresetn] [get_bd_pins matmulFPGA_ompss/ap_rst_n] [get_bd_pins new_task_spawner/rstn] [get_bd_pins accID/aresetn]

current_bd_instance /matmulBlock_0
connect_bd_intf_net [get_bd_intf_pins accID/M_AXIS] [get_bd_intf_pins outStream]
connect_bd_intf_net [get_bd_intf_pins inStream] [get_bd_intf_pins matmulBlock_ompss/mcxx_inPort]
connect_bd_intf_net [get_bd_intf_pins matmulBlock_ompss/m_axi_mcxx_memport] [get_bd_intf_pins memport]
connect_bd_intf_net [get_bd_intf_pins matmulBlock_ompss/mcxx_outPort] [get_bd_intf_pins accID/S_AXIS]
connect_bd_net [get_bd_pins aclk] [get_bd_pins matmulBlock_ompss/ap_clk] [get_bd_pins accID/clk]
connect_bd_net [get_bd_pins managed_aresetn] [get_bd_pins matmulBlock_ompss/ap_rst_n] [get_bd_pins accID/aresetn]

current_bd_instance /
connect_bd_intf_net [get_bd_intf_pins Hardware_Runtime/S_AXI_GP] [get_bd_intf_pins master_Inter_0/M02_AXI]
connect_bd_intf_net [get_bd_intf_pins bitInfo_BRAM_Ctrl/BRAM_PORTA] [get_bd_intf_pins bitinfo/BRAM_PORTA]
connect_bd_intf_net [get_bd_intf_pins bridge_to_host/M_AXI] [get_bd_intf_pins slave_Inter_0/S00_AXI]
connect_bd_intf_net [get_bd_intf_pins bridge_to_host/M_AXI_LITE] [get_bd_intf_pins master_Inter_0/S00_AXI]
connect_bd_intf_net [get_bd_intf_ports ddr4_sdram_c0] [get_bd_intf_pins bridge_to_host/DDR_0_SDRAM]
connect_bd_intf_net [get_bd_intf_ports ddr4_sdram_c1] [get_bd_intf_pins bridge_to_host/DDR_1_SDRAM]
connect_bd_intf_net [get_bd_intf_pins matmulFPGA_0/inStream] [get_bd_intf_pins Hardware_Runtime/M0_AXIS]
connect_bd_intf_net [get_bd_intf_pins matmulBlock_0/inStream] [get_bd_intf_pins Hardware_Runtime/M1_AXIS]
connect_bd_intf_net [get_bd_intf_pins bitInfo_BRAM_Ctrl/S_AXI] [get_bd_intf_pins master_Inter_0/M00_AXI]
connect_bd_intf_net [get_bd_intf_pins managed_reset/S_AXI] [get_bd_intf_pins master_Inter_0/M01_AXI]
connect_bd_intf_net [get_bd_intf_pins matmulBlock_0/memport] [get_bd_intf_pins slave_Inter_0/S04_AXI]
connect_bd_intf_net [get_bd_intf_pins matmulBlock_0/outStream] [get_bd_intf_pins Hardware_Runtime/S1_AXIS]
connect_bd_intf_net [get_bd_intf_pins matmulFPGA_0/a] [get_bd_intf_pins slave_Inter_0/S01_AXI]
connect_bd_intf_net [get_bd_intf_pins matmulFPGA_0/b] [get_bd_intf_pins slave_Inter_0/S02_AXI]
connect_bd_intf_net [get_bd_intf_pins matmulFPGA_0/c] [get_bd_intf_pins slave_Inter_0/S03_AXI]
connect_bd_intf_net [get_bd_intf_pins matmulFPGA_0/outStream] [get_bd_intf_pins Hardware_Runtime/S0_AXIS]
connect_bd_intf_net [get_bd_intf_ports pcie_refclk] [get_bd_intf_pins bridge_to_host/pcie_refclk]
connect_bd_intf_net [get_bd_intf_ports pci_express_x8] [get_bd_intf_pins bridge_to_host/pci_express_x8]
connect_bd_intf_net [get_bd_intf_pins slave_Inter_0/M00_AXI] [get_bd_intf_pins bridge_to_host/DDR_0_S_AXI]
connect_bd_intf_net [get_bd_intf_pins slave_Inter_0/M01_AXI] [get_bd_intf_pins bridge_to_host/DDR_1_S_AXI]
connect_bd_intf_net [get_bd_intf_ports sysclk0] [get_bd_intf_pins bridge_to_host/DDR_0_SYS_CLK]
connect_bd_intf_net [get_bd_intf_ports sysclk1] [get_bd_intf_pins bridge_to_host/DDR_1_SYS_CLK]
connect_bd_net [get_bd_pins HBM_CATTRIP_constant/dout] [get_bd_ports HBM_CATTRIP]
connect_bd_net -net M00_ARESETN_1 [get_bd_pins bridge_to_host/DDR_0_peripheral_aresetn] [get_bd_pins slave_Inter_0/M00_ARESETN]
connect_bd_net -net M01_ACLK_1 [get_bd_pins bridge_to_host/DDR_1_ui_clk] [get_bd_pins slave_Inter_0/M01_ACLK]
connect_bd_net -net M01_ARESETN_1 [get_bd_pins bridge_to_host/DDR_1_peripheral_aresetn] [get_bd_pins slave_Inter_0/M01_ARESETN]
connect_bd_net -net S00_ACLK_1 [get_bd_pins bridge_to_host/aclk] [get_bd_pins slave_Inter_0/S00_ACLK]
connect_bd_net -net S00_ARESETN_1 [get_bd_pins bridge_to_host/aresetn] [get_bd_pins slave_Inter_0/S00_ARESETN]
connect_bd_net [get_bd_pins bridge_to_host/ui_clk] [get_bd_pins clock_generator/clk_in1] [get_bd_pins slave_Inter_0/M00_ACLK]
connect_bd_net -net clk_app_1 [get_bd_pins clock_generator/clk_app] \
  [get_bd_pins bridge_to_host/clk_app] [get_bd_pins system_reset/clk_app] [get_bd_pins slave_Inter_0/ACLK] \
  [get_bd_pins master_Inter_0/ACLK] [get_bd_pins master_Inter_0/S00_ACLK] [get_bd_pins bitInfo_BRAM_Ctrl/s_axi_aclk] \
  [get_bd_pins master_Inter_0/M00_ACLK] [get_bd_pins managed_reset/s_axi_aclk] [get_bd_pins master_Inter_0/M01_ACLK] \
  [get_bd_pins Hardware_Runtime/clk] [get_bd_pins master_Inter_0/M02_ACLK] [get_bd_pins matmulFPGA_0/aclk] \
  [get_bd_pins matmulBlock_0/aclk] [get_bd_pins slave_Inter_0/S01_ACLK] [get_bd_pins slave_Inter_0/S02_ACLK] \
  [get_bd_pins slave_Inter_0/S03_ACLK] [get_bd_pins slave_Inter_0/S04_ACLK]
connect_bd_net -net clk_app_rstn_1 [get_bd_pins system_reset/clk_app_rstn] \
  [get_bd_pins bridge_to_host/clk_app_rstn] [get_bd_pins slave_Inter_0/ARESETN] [get_bd_pins master_Inter_0/ARESETN] \
  [get_bd_pins master_Inter_0/S00_ARESETN] [get_bd_pins bitInfo_BRAM_Ctrl/s_axi_aresetn] \
  [get_bd_pins master_Inter_0/M00_ARESETN] [get_bd_pins managed_reset/s_axi_aresetn] [get_bd_pins master_Inter_0/M01_ARESETN] \
  [get_bd_pins Hardware_Runtime/rstn] [get_bd_pins master_Inter_0/M02_ARESETN]
connect_bd_net [get_bd_pins clock_generator/locked] [get_bd_pins system_reset/clk_gen_locked]
connect_bd_net [get_bd_pins managed_reset/gpio_io_o] [get_bd_pins system_reset/managed_reset]
connect_bd_net -net managed_rstn_1 [get_bd_pins system_reset/clk_app_managed_rstn] \
  [get_bd_pins Hardware_Runtime/managed_rstn] [get_bd_pins matmulFPGA_0/managed_aresetn] \
  [get_bd_pins matmulBlock_0/managed_aresetn] [get_bd_pins slave_Inter_0/S01_ARESETN] [get_bd_pins slave_Inter_0/S02_ARESETN] \
  [get_bd_pins slave_Inter_0/S03_ARESETN] [get_bd_pins slave_Inter_0/S04_ARESETN]
connect_bd_net [get_bd_ports pcie_perstn] \
  [get_bd_pins bridge_to_host/pcie_perstn] [get_bd_pins clock_generator/resetn] [get_bd_pins system_reset/pcie_perstn]
